# Altium project Project.PrjPcb
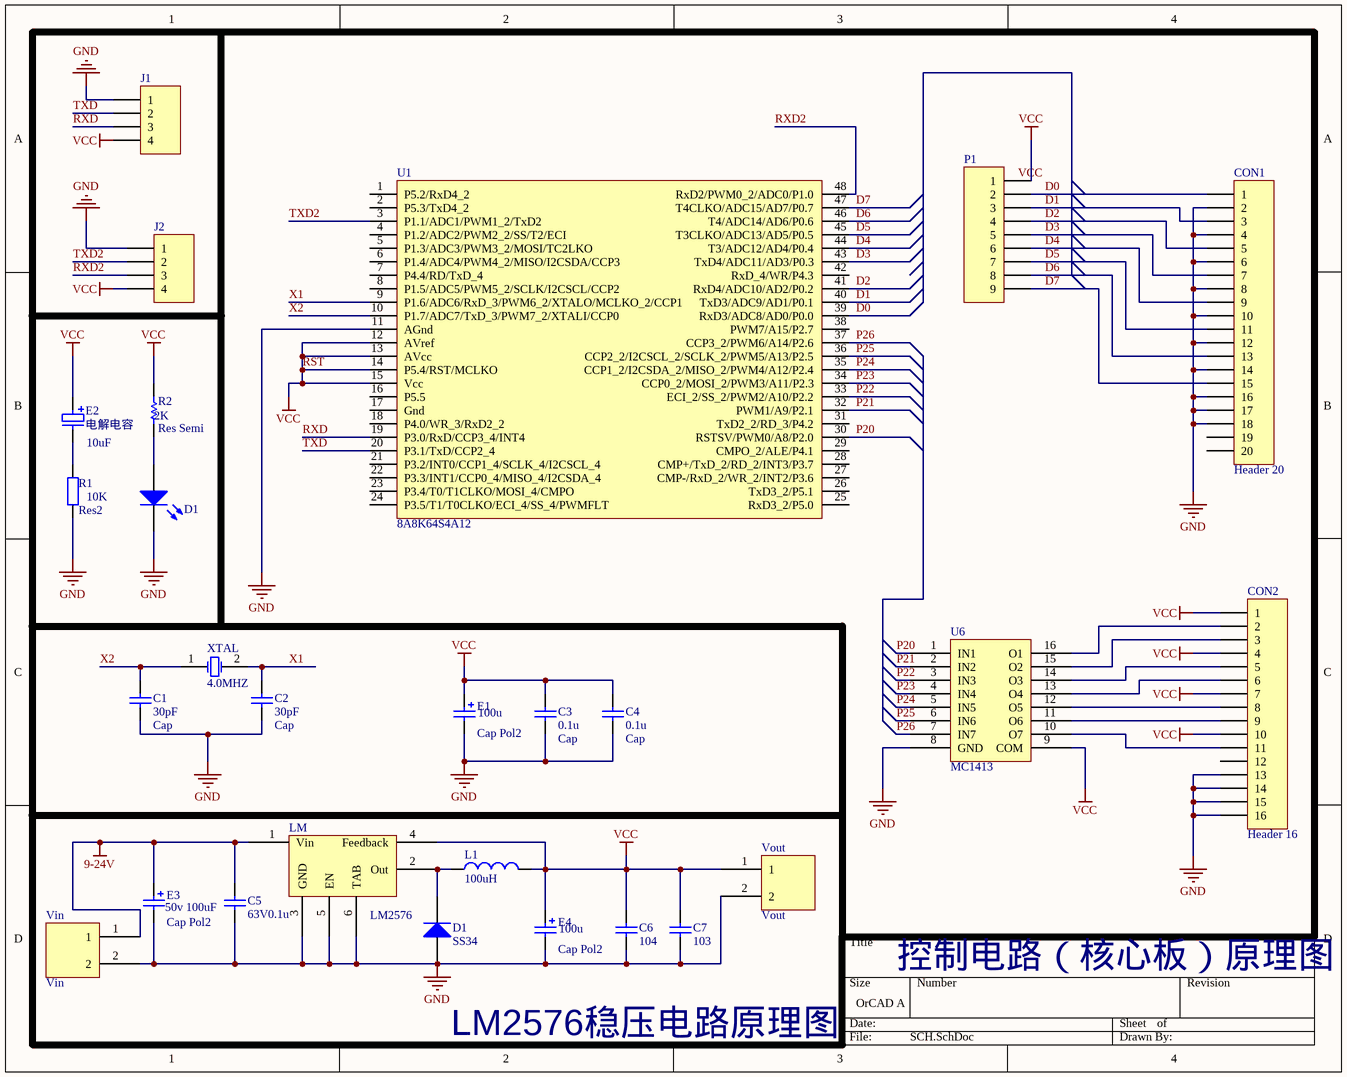
[diagram p0: SCH.SchDoc]
1 sheet, 27 parts. Net scope: global (net labels, ports and power ports of the same name join across sheets).
Board file: PCB.PcbDoc

## Sheet SCH.SchDoc
size OrCAD A; SheetNumber: 1; SheetTotal: 1; SPICEModelCacheCJYMIXTO: <root> / <DocumentId>CJYMIXTO</DocumentId> / <CacheFrame Number="0"> / <Model Name="res" Kind="MDL"> / <Text>*Default semiconductor resistor / .MODEL RES R()</Text> / </Model> / </CacheFrame> / </root>

### Parts
(Parts that share a designator on the sheet are numbered #1, #2 ... from top to bottom, then left to right.)
C1  Cap  value 30pF  [PCBComponent_1]
C2  Cap  value 30pF  [PCBComponent_1]
C3  Cap  value 0.1u  [PCBComponent_1]
C4  Cap  value 0.1u  [PCBComponent_1]
C5  63V0.1u  [0603/C]
C6  104  [0603/C]
C7  103  [0603/C]
CON1  Header 20  [HDR1X20]
CON2  Header 16  [HDR1X16]
D1#1  LED3  [LED/0603]  (value not drawn)
D1#2  SS34  [100u]
E1  Cap Pol2  value 100u  [PCBComponent_1]
E2  电解电容  [PCBComponent_1]
E3  Cap Pol2  value 50v 100uF  [Inductor]
E4  Cap Pol2  value 100u  [Inductor]
J1  Header 4  [HDR1X4]  (value not drawn)
J2  Header 4  [HDR1X4]  (value not drawn)
L1  value 100uH  [Inductor]  (hidden comment: Inductor)
LM  LM2576  [TO-263-5]
P1  Header 9  [P2.54/9PIN]  (value not drawn)
R1  Res2  value 10K  [AXIAL-0.4]
R2  Res Semi  value 2K  [AXIAL-0.5]
U1  8A8K64S4A12  [LQFP48]
U6  MC1413  [dip-16]
Vin  Vin  [V]
Vout  Vout  [V]
XTAL  4.0MHZ  [PCBComponent_1]

### Nets
9-24V: C5.2 E3.1 LM.1(Vin) Vin.1
GND: C1.1 C2.1 C3.1 C4.1 C5.1 C6.1 C7.1 CON1.2 CON1.4 CON1.6 CON1.8 CON1.10 CON1.12 CON1.14 CON1.16 CON1.17 CON1.18 CON2.13 CON2.14 CON2.15 CON2.16 D1#1.2(K) D1#2.1(A) E1.2 E3.2 E4.2 J1.1 J2.1 LM.3(GND) LM.5(EN) LM.6(TAB) R1.1 U1.11(AGnd) U6.8(GND) Vin.2 Vout.2
RST: C3.2 C4.2 C6.2 C7.2 CON2.1 CON2.4 CON2.7 CON2.10 E1.1 E2.1 E4.1 J1.4 J2.4 L1.2 LM.4(Feedback) P1.1 R2.2 U1.12(AVref) U1.13(AVcc) U1.14(P5.4/RST/MCLKO) U1.15(Vcc) U6.9(COM) Vout.1  [also labelled VCC]
D0: CON1.1 P1.2 U1.39(RxD3/ADC8/AD0/P0.0)
D1: CON1.3 P1.3 U1.40(TxD3/ADC9/AD1/P0.1)
D2: CON1.5 P1.4 U1.41(RxD4/ADC10/AD2/P0.2)
D3: CON1.7 P1.5 U1.43(TxD4/ADC11/AD3/P0.3)
D4: CON1.9 P1.6 U1.44(T3/ADC12/AD4/P0.4)
D5: CON1.11 P1.7 U1.45(T3CLKO/ADC13/AD5/P0.5)
D6: CON1.13 P1.8 U1.46(T4/ADC14/AD6/P0.6)
D7: CON1.15 P1.9 U1.47(T4CLKO/ADC15/AD7/P0.7)
P20: U1.30(RSTSV/PWM0/A8/P2.0) U6.1(IN1)
P21: U1.32(PWM1/A9/P2.1) U6.2(IN2)
P22: U1.33(ECI_2/SS_2/PWM2/A10/P2.2) U6.3(IN3)
P23: U1.34(CCP0_2/MOSI_2/PWM3/A11/P2.3) U6.4(IN4)
P24: U1.35(CCP1_2/I2CSDA_2/MISO_2/PWM4/A12/P2.4) U6.5(IN5)
P25: U1.36(CCP2_2/I2CSCL_2/SCLK_2/PWM5/A13/P2.5) U6.6(IN6)
P26: U1.37(CCP3_2/PWM6/A14/P2.6) U6.7(IN7)
RXD: J1.3 U1.19(P3.0/RxD/CCP3_4/INT4)
RXD2: J2.3 U1.48(RxD2/PWM0_2/ADC0/P1.0)
TXD: J1.2 U1.20(P3.1/TxD/CCP2_4)
TXD2: J2.2 U1.3(P1.1/ADC1/PWM1_2/TxD2)
X1: C2.2 U1.9(P1.6/ADC6/RxD_3/PWM6_2/XTALO/MCLKO_2/CCP1) XTAL.2(OSC2)
X2: C1.2 U1.10(P1.7/ADC7/TxD_3/PWM7_2/XTALI/CCP0) XTAL.1(OSC1)
NetCON2_2: CON2.2 U6.16(O1)
NetCON2_3: CON2.3 U6.15(O2)
NetCON2_5: CON2.5 U6.14(O3)
NetCON2_6: CON2.6 U6.13(O4)
NetCON2_8: CON2.8 U6.12(O5)
NetCON2_9: CON2.9 U6.11(O6)
NetCON2_11: CON2.11 U6.10(O7)
NetD1#1_1: D1#1.1(A) R2.1
NetD1#2_2: D1#2.2(K) L1.1 LM.2(Out)
NetE2_2: E2.2 R1.2

Not connected (* = marked no-connect by the designer): CON1 19 20; CON2 12; U1 1(P5.2/RxD4_2) 2(P5.3/TxD4_2) 4(P1.2/ADC2/PWM2_2/SS/T2/ECI) 5(P1.3/ADC3/PWM3_2/MOSI/TC2LKO) 6(P1.4/ADC4/PWM4_2/MISO/I2CSDA/CCP3) 7(P4.4/RD/TxD_4) 8(P1.5/ADC5/PWM5_2/SCLK/I2CSCL/CCP2) 16(P5.5) 17(Gnd) 18(P4.0/WR_3/RxD2_2) 21(P3.2/INT0/CCP1_4/SCLK_4/I2CSCL_4) 22(P3.3/INT1/CCP0_4/MISO_4/I2CSDA_4) 23(P3.4/T0/T1CLKO/MOSI_4/CMPO) 24(P3.5/T1/T0CLKO/ECI_4/SS_4/PWMFLT) 25(RxD3_2/P5.0) 26(TxD3_2/P5.1) 27(CMP-/RxD_2/WR_2/INT2/P3.6) 28(CMP+/TxD_2/RD_2/INT3/P3.7) 29(CMPO_2/ALE/P4.1) 31(TxD2_2/RD_3/P4.2) 38(PWM7/A15/P2.7) 42(RxD_4/WR/P4.3)

### Notes on the sheet
- (near E2) 10uF
- 控制电路（核心板）原理图
- LM2576稳压电路原理图
- Labels drawn without touching a wire or pin: VCC

### Library data of the parts
C1-C4 = Cap: Capacitor; Published: 8-Jun-2000; LatestRevisionDate: 17-Jul-2002; LatestRevisionNote: Re-released for DXP Platform.; PackageReference: RAD-0.3; Publisher: Altium Limited; PackageDescription: Radial Cap, Thru-Hole; 2 Leads; 0.3 in Pin Spacing
C5-C7 = 0603/C
CON1 = Header 20: Header, 20-Pin; LatestRevisionDate: 17-Jul-2002; LatestRevisionNote: Re-released for DXP Platform.; Publisher: Altium Limited
CON2 = Header 16: Header, 16-Pin; LatestRevisionDate: 17-Jul-2002; LatestRevisionNote: Re-released for DXP Platform.; Publisher: Altium Limited
D1#1 = LED3: Typical BLUE SiC LED; Published: 8-Jun-2000; LatestRevisionDate: 17-Dec-2003; LatestRevisionNote: PCB Footprint replaced.; DatasheetVersion: 16-Apr-2002; PackageVersion: 16-Apr-2002; PackageReference: 3.5X2.8X1.9; Publisher: Altium Limited; PackageDescription: SM LED; 2 C-Bend Leads; Body 3.5 x 2.8 x 1.9 mm, inc leads (LxWxH typ)
D1#2 = SS34: Default Diode; Manufacturer: Generic Components; Class: Discrete; SubClass: Diode - Switching; Published: 08/06/2000; Publisher: Altium Hobart Technology Centre
E1 E3 E4 = Cap Pol2: Polarized Capacitor (Axial); Published: 8-Jun-2000; LatestRevisionDate: 17-Jul-2002; LatestRevisionNote: Re-released for DXP Platform.; PackageReference: POLAR0.8; Publisher: Altium Limited; PackageDescription: Polarized Capacitor; 2 Leads
J1 J2 = Header 4: Header, 4-Pin; LatestRevisionDate: 17-Jul-2002; LatestRevisionNote: Re-released for DXP Platform.; Publisher: Altium Limited
L1 = Inductor: Manufacturer: Generic Components; Class: Passive; Published: 08/06/2000; Publisher: Altium Hobart Technology Centre; SubClass: Inductor
P1 = Header 9: Header, 9-Pin; LatestRevisionDate: 17-Jul-2002; LatestRevisionNote: Re-released for DXP Platform.; Publisher: Altium Limited
R1 = Res2: Resistor; Published: 8-Jun-2000; LatestRevisionDate: 17-Jul-2002; LatestRevisionNote: Re-released for DXP Platform.; PackageReference: AXIAL-0.4; Publisher: Altium Limited; PackageDescription: Axial Device, Thru-Hole; 2 Leads; 0.4 in Pin Spacing
R2 = Res Semi: Semiconductor Resistor; Published: 8-Jun-2000; LatestRevisionDate: 17-Jul-2002; LatestRevisionNote: Re-released for DXP Platform.; PackageReference: AXIAL-0.5; Publisher: Altium Limited; PackageDescription: Axial Device, Thru-Hole; 2 Leads; 0.5 in Pin Spacing
XTAL = XTAL: Crystal Oscillator; Manufacturer: Generic Components; Published: 08/06/2000; Publisher: Altium Hobart Technology Centre; Class: Oscillator; SubClass: Crystal Oscillator